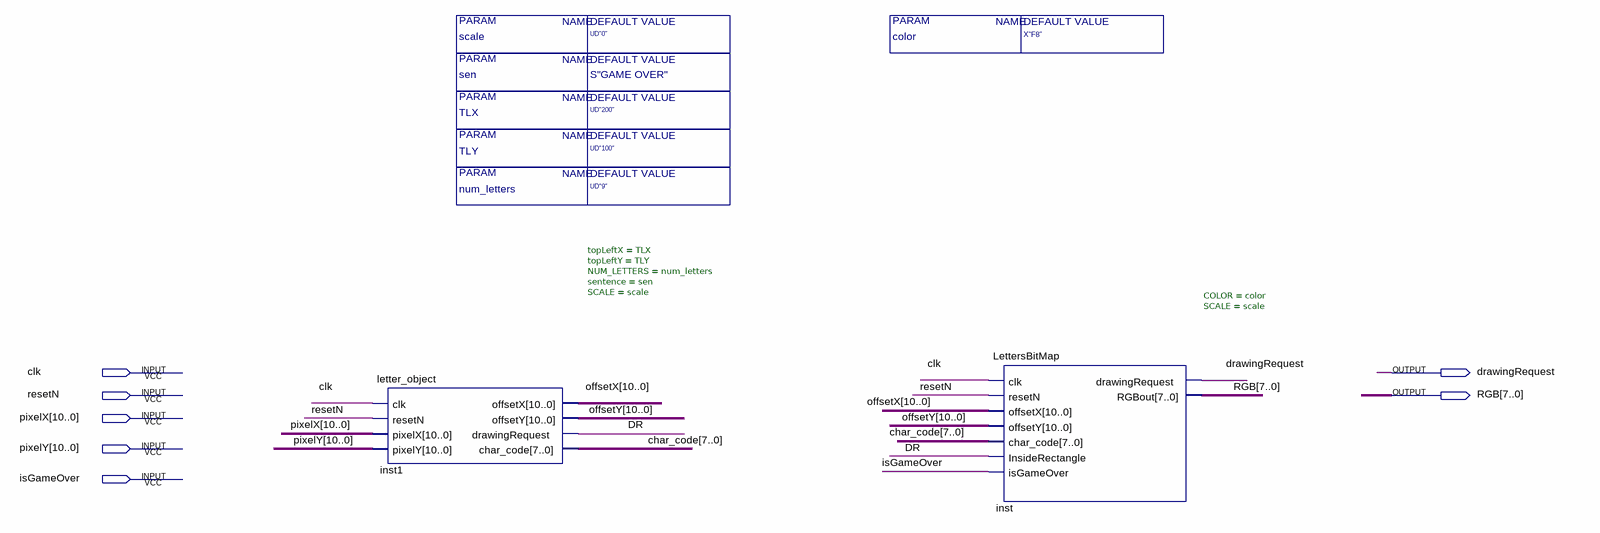
[diagram p0: schematic sheet]
// Quartus schematic sentence_block_T.bdf as structural Verilog: 2 symbols, 7 pins
module sentence_block_T #(parameter sen = "S\"GAME OVER\"", parameter TLY = "UD\"100\"", parameter TLX = "UD\"200\"", parameter num_letters = "UD\"9\"", parameter color = "X\"F8\"", parameter scale = "UD\"0\"") (
  input  clk,
  input  resetN,
  input  [10:0] pixelX,
  input  [10:0] pixelY,
  input  isGameOver,
  output drawingRequest,
  output [7:0] RGB
);

  wire DR;
  wire [7:0] char_code;
  wire [10:0] offsetX, offsetY;

  letter_object #(.topLeftX(TLX), .topLeftY(TLY), .NUM_LETTERS(num_letters), .sentence(sen), .SCALE(scale)) inst1 (
    .clk(clk), .resetN(resetN), .pixelX(pixelX), .pixelY(pixelY), .offsetX(offsetX), .offsetY(offsetY),
    .drawingRequest(DR), .char_code(char_code));
  LettersBitMap #(.COLOR(color), .SCALE(scale)) inst (
    .clk(clk), .resetN(resetN), .offsetX(offsetX), .offsetY(offsetY), .char_code(char_code),
    .InsideRectangle(DR), .isGameOver(isGameOver), .drawingRequest(drawingRequest), .RGBout(RGB));
endmodule
